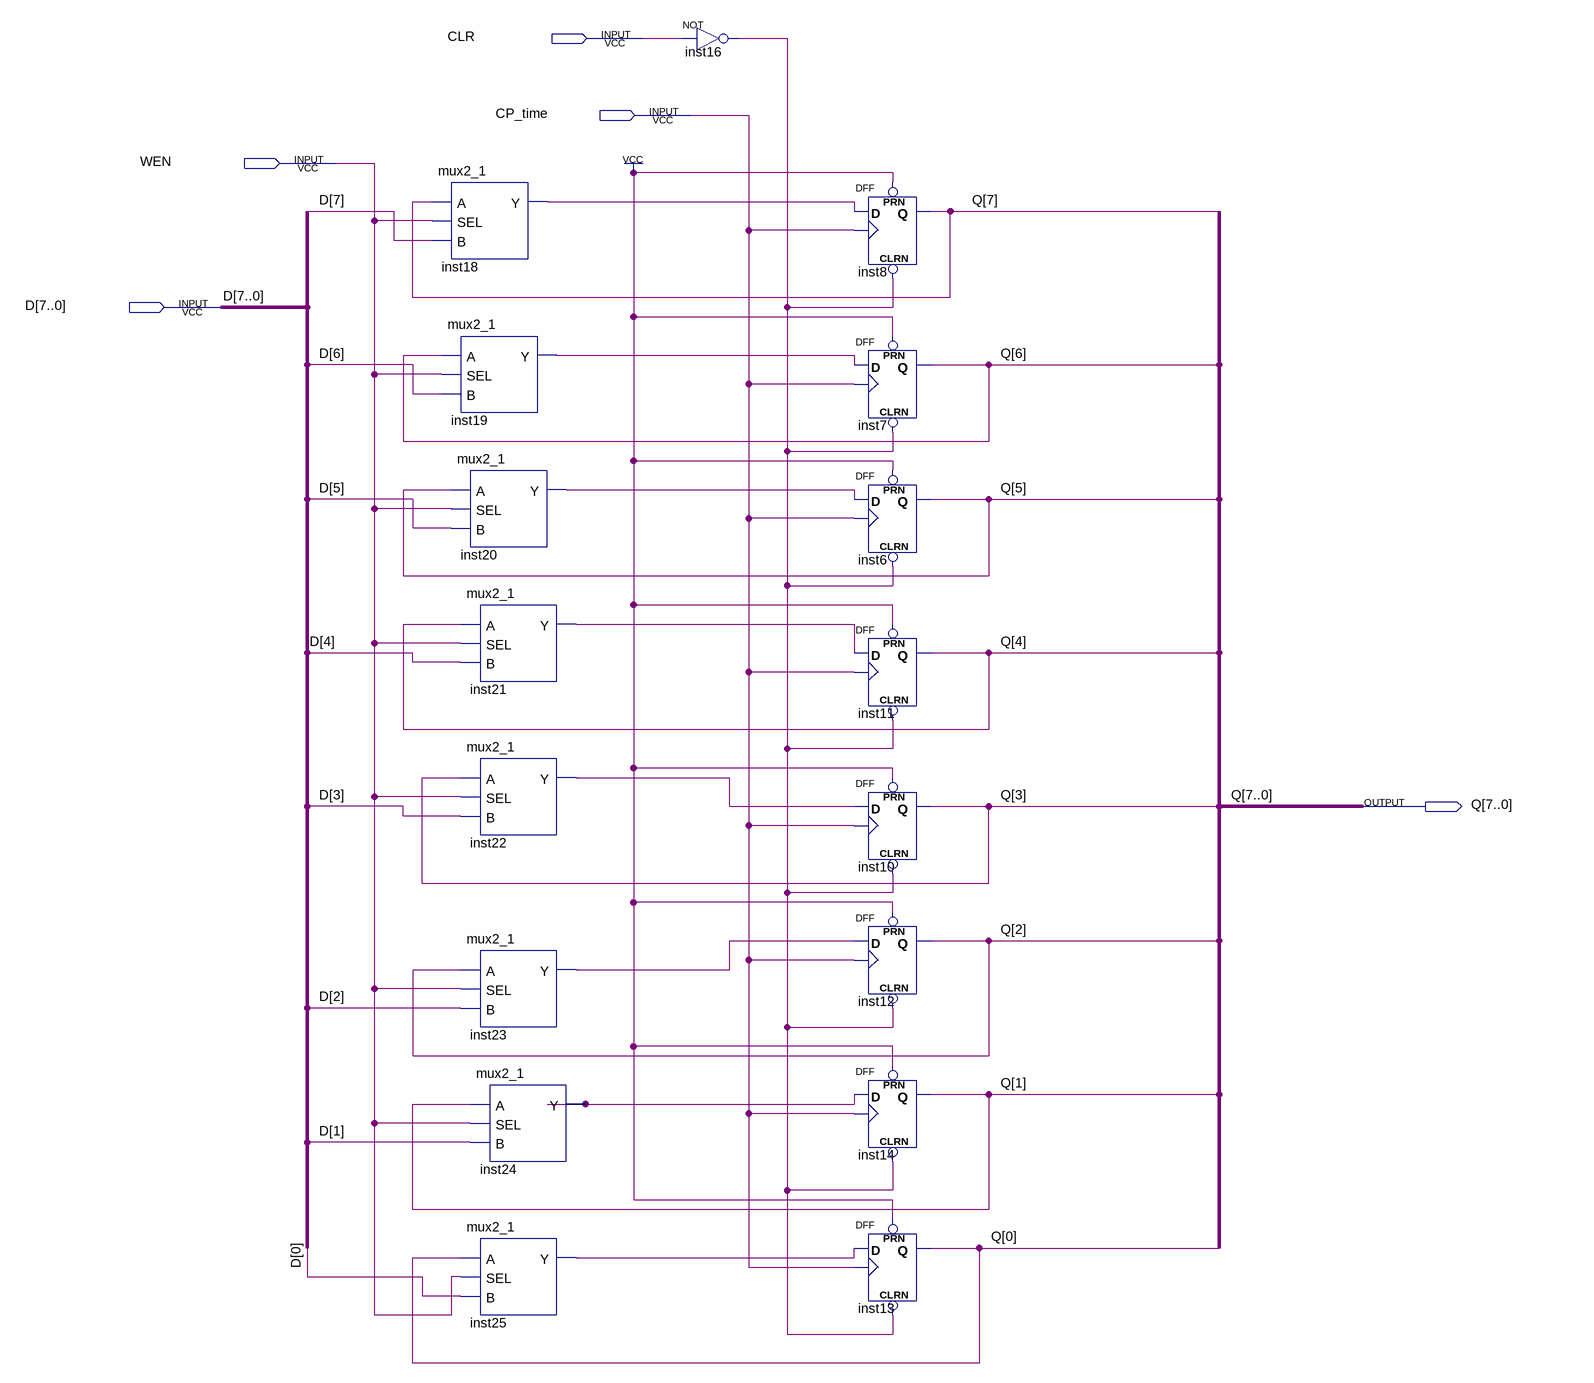
[diagram p0: schematic sheet]
// Quartus schematic register8.bdf as structural Verilog: 17 symbols, 5 pins
module register8 (
  input  CLR,
  input  CP_time,
  input  WEN,
  input  [7:0] D,
  output [7:0] Q
);

  wire inst16_out, inst18_y, inst19_y, inst20_y, inst21_y, inst22_y, inst23_y, inst24_y, inst25_y;

  mux2_1 inst18 (.A(Q[7]), .SEL(WEN), .B(D[7]), .Y(inst18_y));
  mux2_1 inst19 (.A(Q[6]), .SEL(WEN), .B(D[6]), .Y(inst19_y));
  mux2_1 inst20 (.A(Q[5]), .SEL(WEN), .B(D[5]), .Y(inst20_y));
  mux2_1 inst21 (.A(Q[4]), .SEL(WEN), .B(D[4]), .Y(inst21_y));
  mux2_1 inst22 (.A(Q[3]), .SEL(WEN), .B(D[3]), .Y(inst22_y));
  mux2_1 inst23 (.A(Q[2]), .SEL(WEN), .B(D[2]), .Y(inst23_y));
  mux2_1 inst24 (.A(Q[1]), .SEL(WEN), .B(D[1]), .Y(inst24_y));
  mux2_1 inst25 (.A(Q[0]), .SEL(WEN), .B(D[0]), .Y(inst25_y));
  not inst16 (inst16_out, CLR);
  DFF inst8 (.CLRN(inst16_out), .CLK(CP_time), .D(inst18_y), .PRN(1'b1), .Q(Q[7]));
  DFF inst7 (.CLRN(inst16_out), .CLK(CP_time), .D(inst19_y), .PRN(1'b1), .Q(Q[6]));
  DFF inst6 (.CLRN(inst16_out), .CLK(CP_time), .D(inst20_y), .PRN(1'b1), .Q(Q[5]));
  DFF inst11 (.CLRN(inst16_out), .CLK(CP_time), .D(inst21_y), .PRN(1'b1), .Q(Q[4]));
  DFF inst10 (.CLRN(inst16_out), .CLK(CP_time), .D(inst22_y), .PRN(1'b1), .Q(Q[3]));
  DFF inst12 (.CLRN(inst16_out), .CLK(CP_time), .D(inst23_y), .PRN(1'b1), .Q(Q[2]));
  DFF inst14 (.CLRN(inst16_out), .CLK(CP_time), .D(inst24_y), .PRN(1'b1), .Q(Q[1]));
  DFF inst13 (.CLRN(inst16_out), .CLK(CP_time), .D(inst25_y), .PRN(1'b1), .Q(Q[0]));
endmodule
